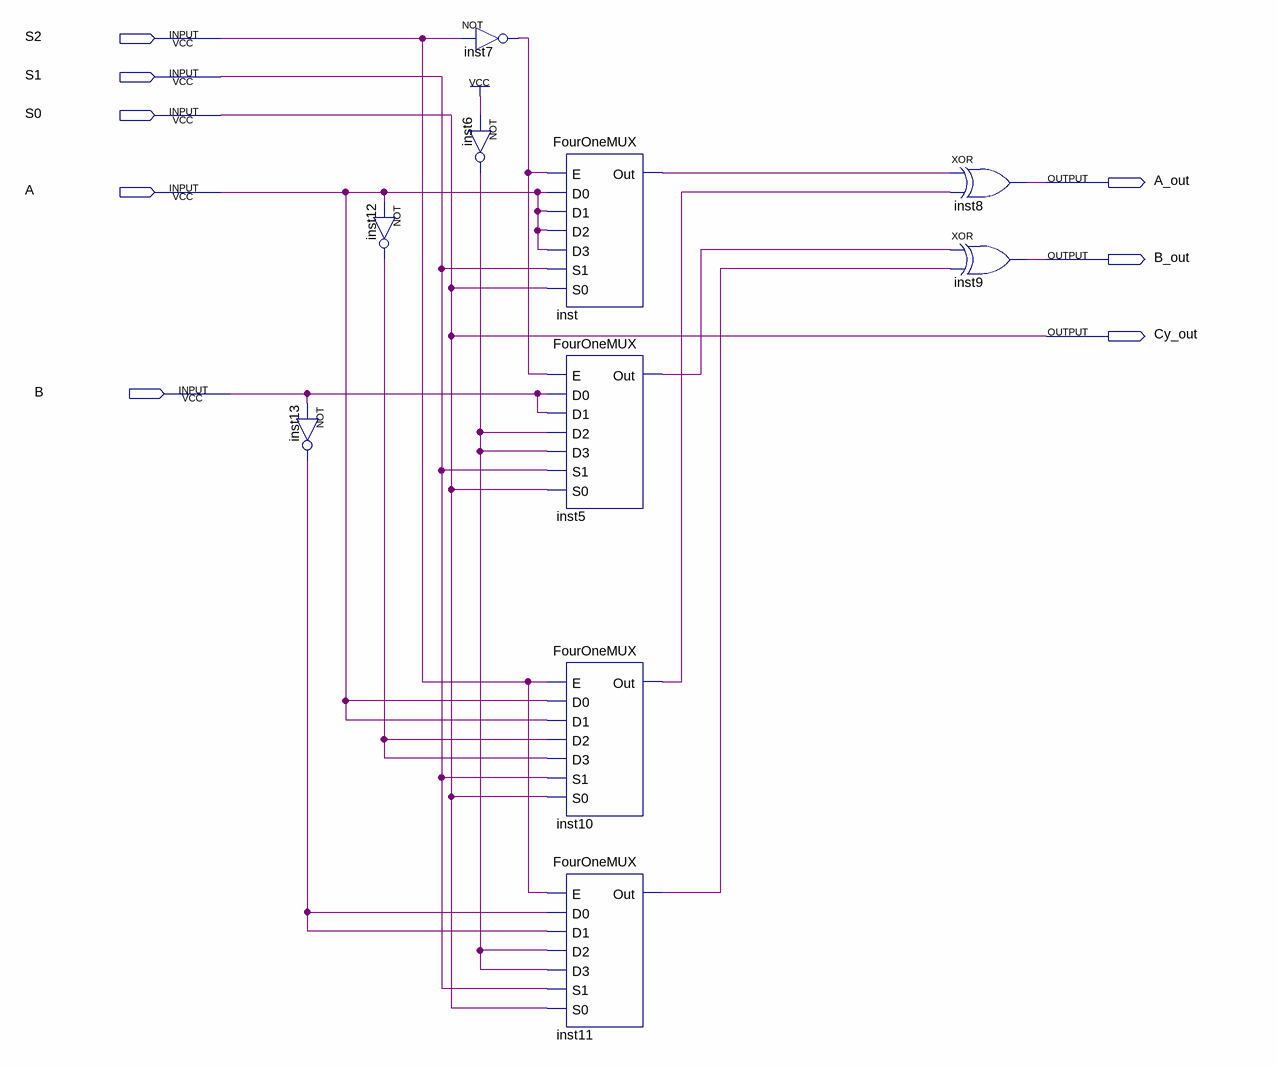
[diagram p0: schematic sheet]
// Quartus schematic 1bitArithmeticCircuit.bdf as structural Verilog: 10 symbols, 8 pins
module \1bitArithmeticCircuit  (
  input  S2,
  input  S1,
  input  S0,
  input  A,
  input  B,
  output A_out,
  output B_out,
  output Cy_out
);

  wire inst5_out, inst6_out, inst7_out, inst10_out, inst11_out, inst12_out, inst13_out, inst_out;

  not inst13 (inst13_out, B);
  not inst12 (inst12_out, A);
  not inst7 (inst7_out, S2);
  not inst6 (inst6_out, 1'b1);
  FourOneMUX inst (.E(inst7_out), .D0(A), .D1(A), .D2(A), .D3(A), .S1(S1), .S0(S0), .Out(inst_out));
  FourOneMUX inst5 (.E(inst7_out), .D0(B), .D1(B), .D2(inst6_out), .D3(inst6_out), .S1(S1), .S0(S0), .Out(inst5_out));
  FourOneMUX inst10 (.E(S2), .D0(A), .D1(A), .D2(inst12_out), .D3(inst12_out), .S1(S1), .S0(S0), .Out(inst10_out));
  FourOneMUX inst11 (
    .E(S2), .D0(inst13_out), .D1(inst13_out), .D2(inst6_out), .D3(inst6_out), .S1(S1), .S0(S0),
    .Out(inst11_out));
  xor inst8 (A_out, inst_out, inst10_out);
  xor inst9 (B_out, inst5_out, inst11_out);

  assign Cy_out = S0;
endmodule
